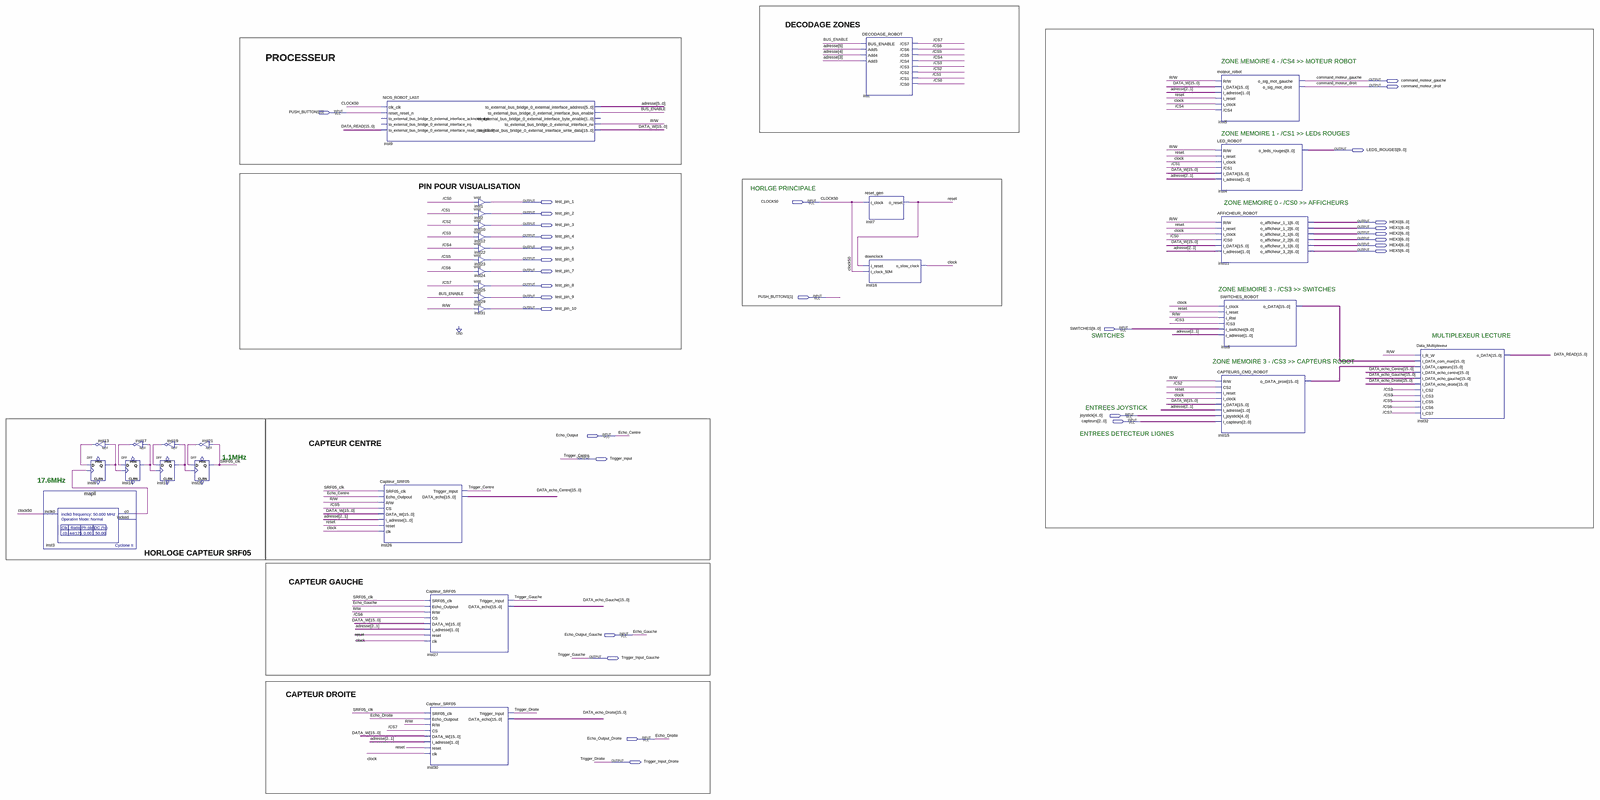
[diagram p0: schematic sheet, whole]
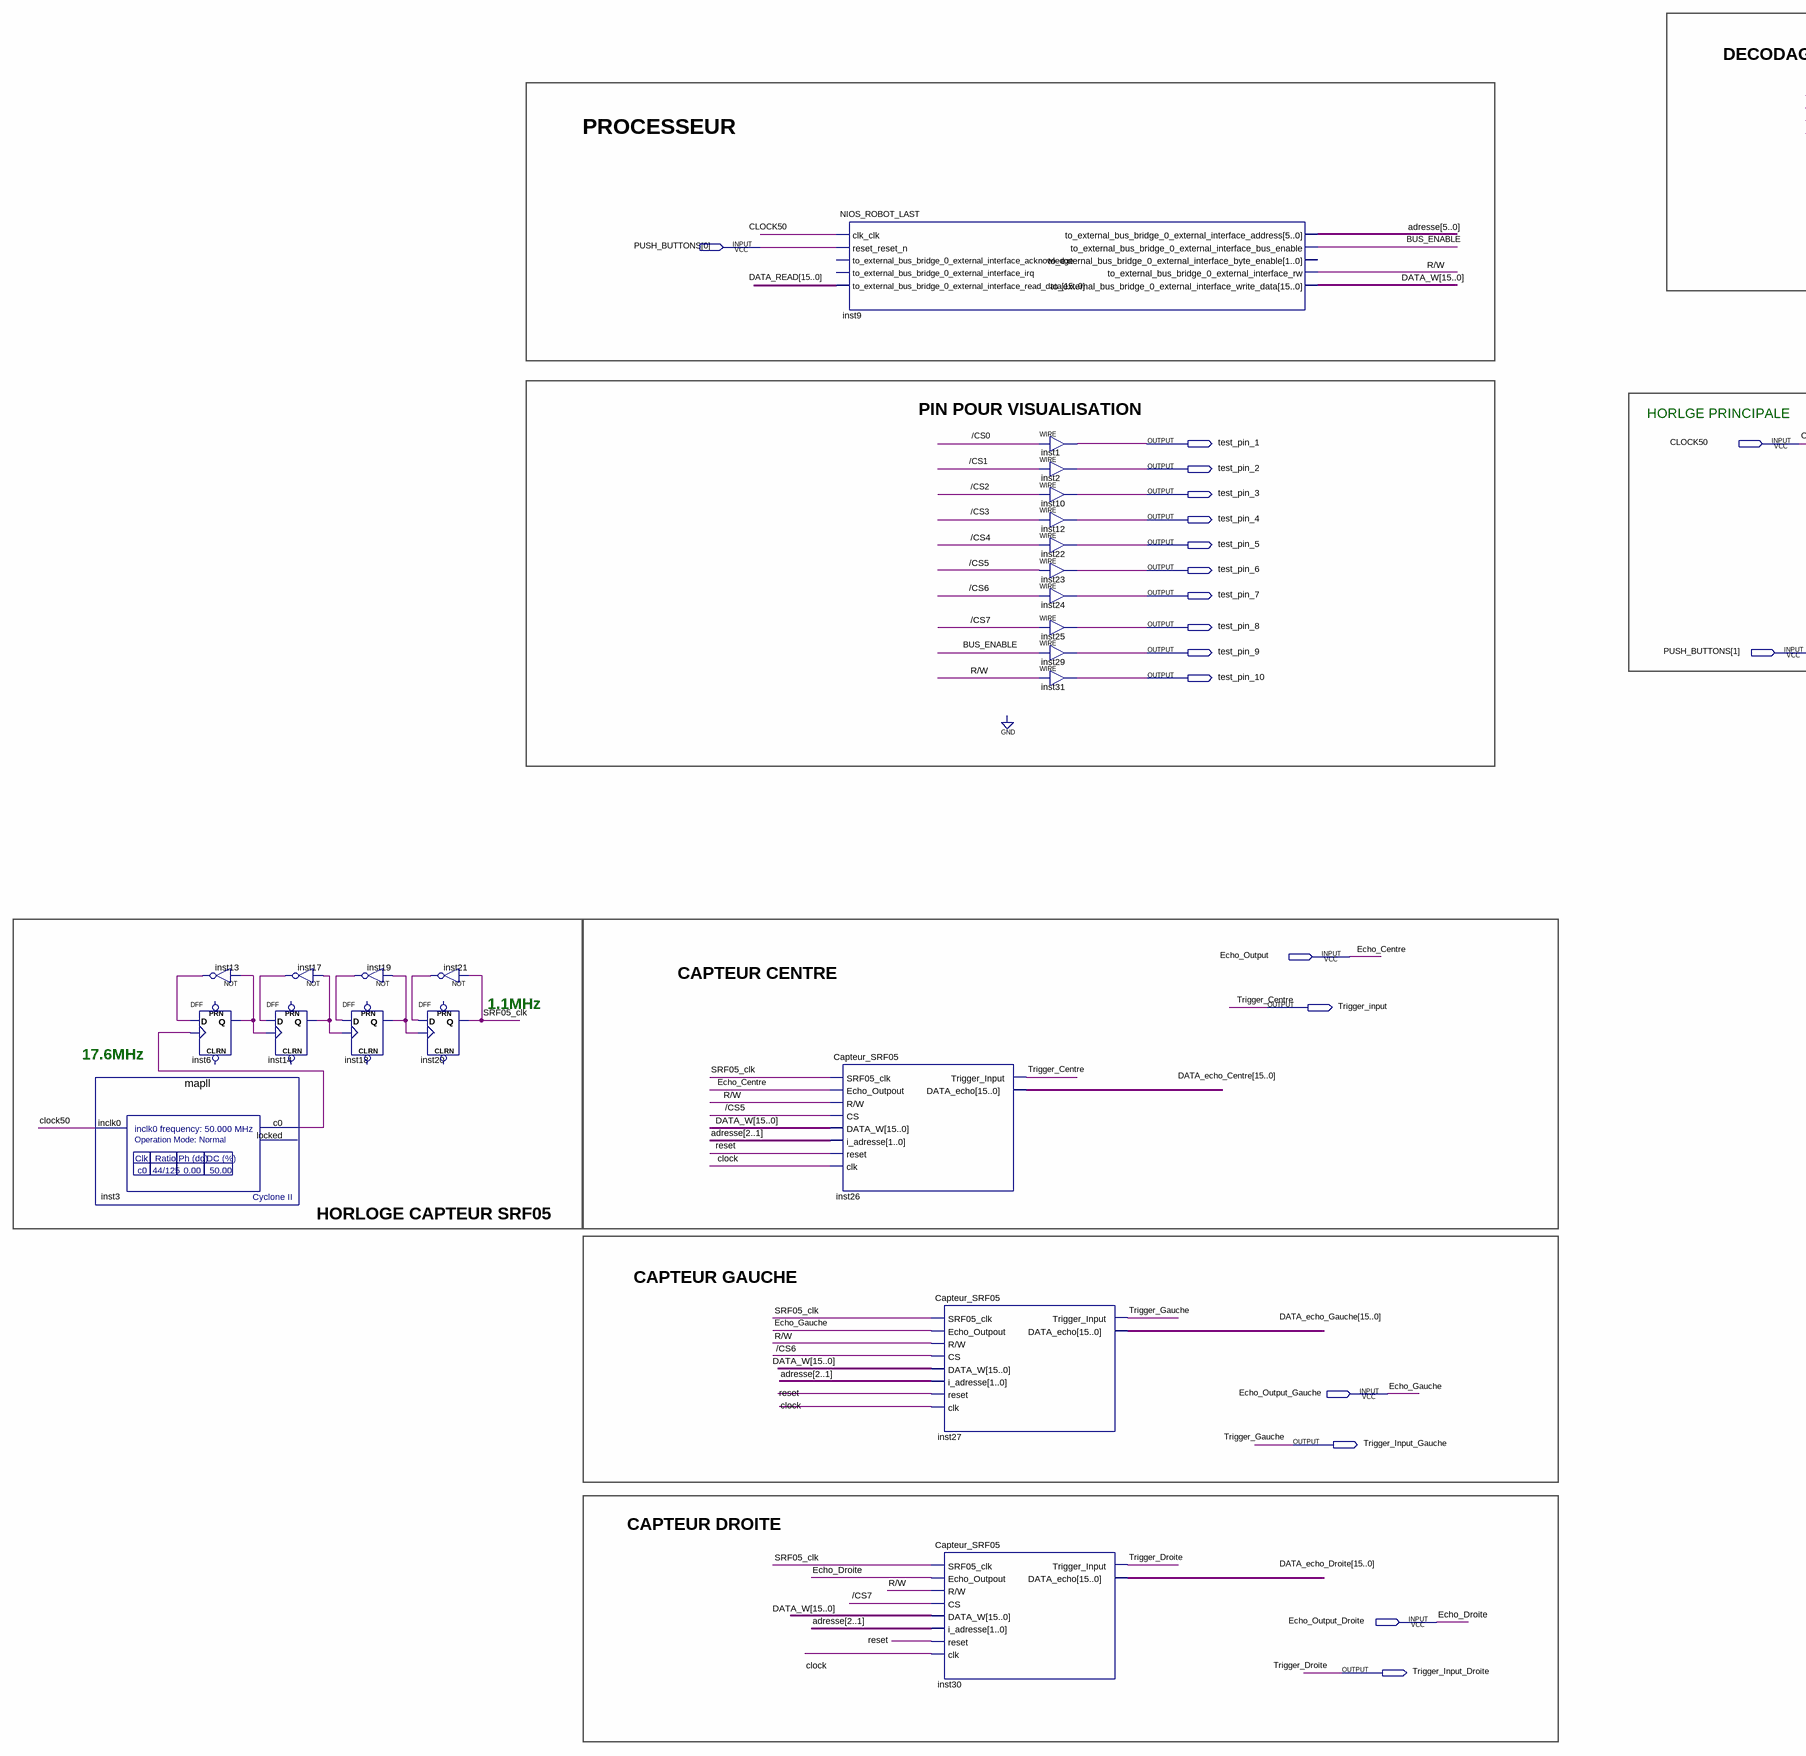
[diagram p1: schematic sheet, left part]
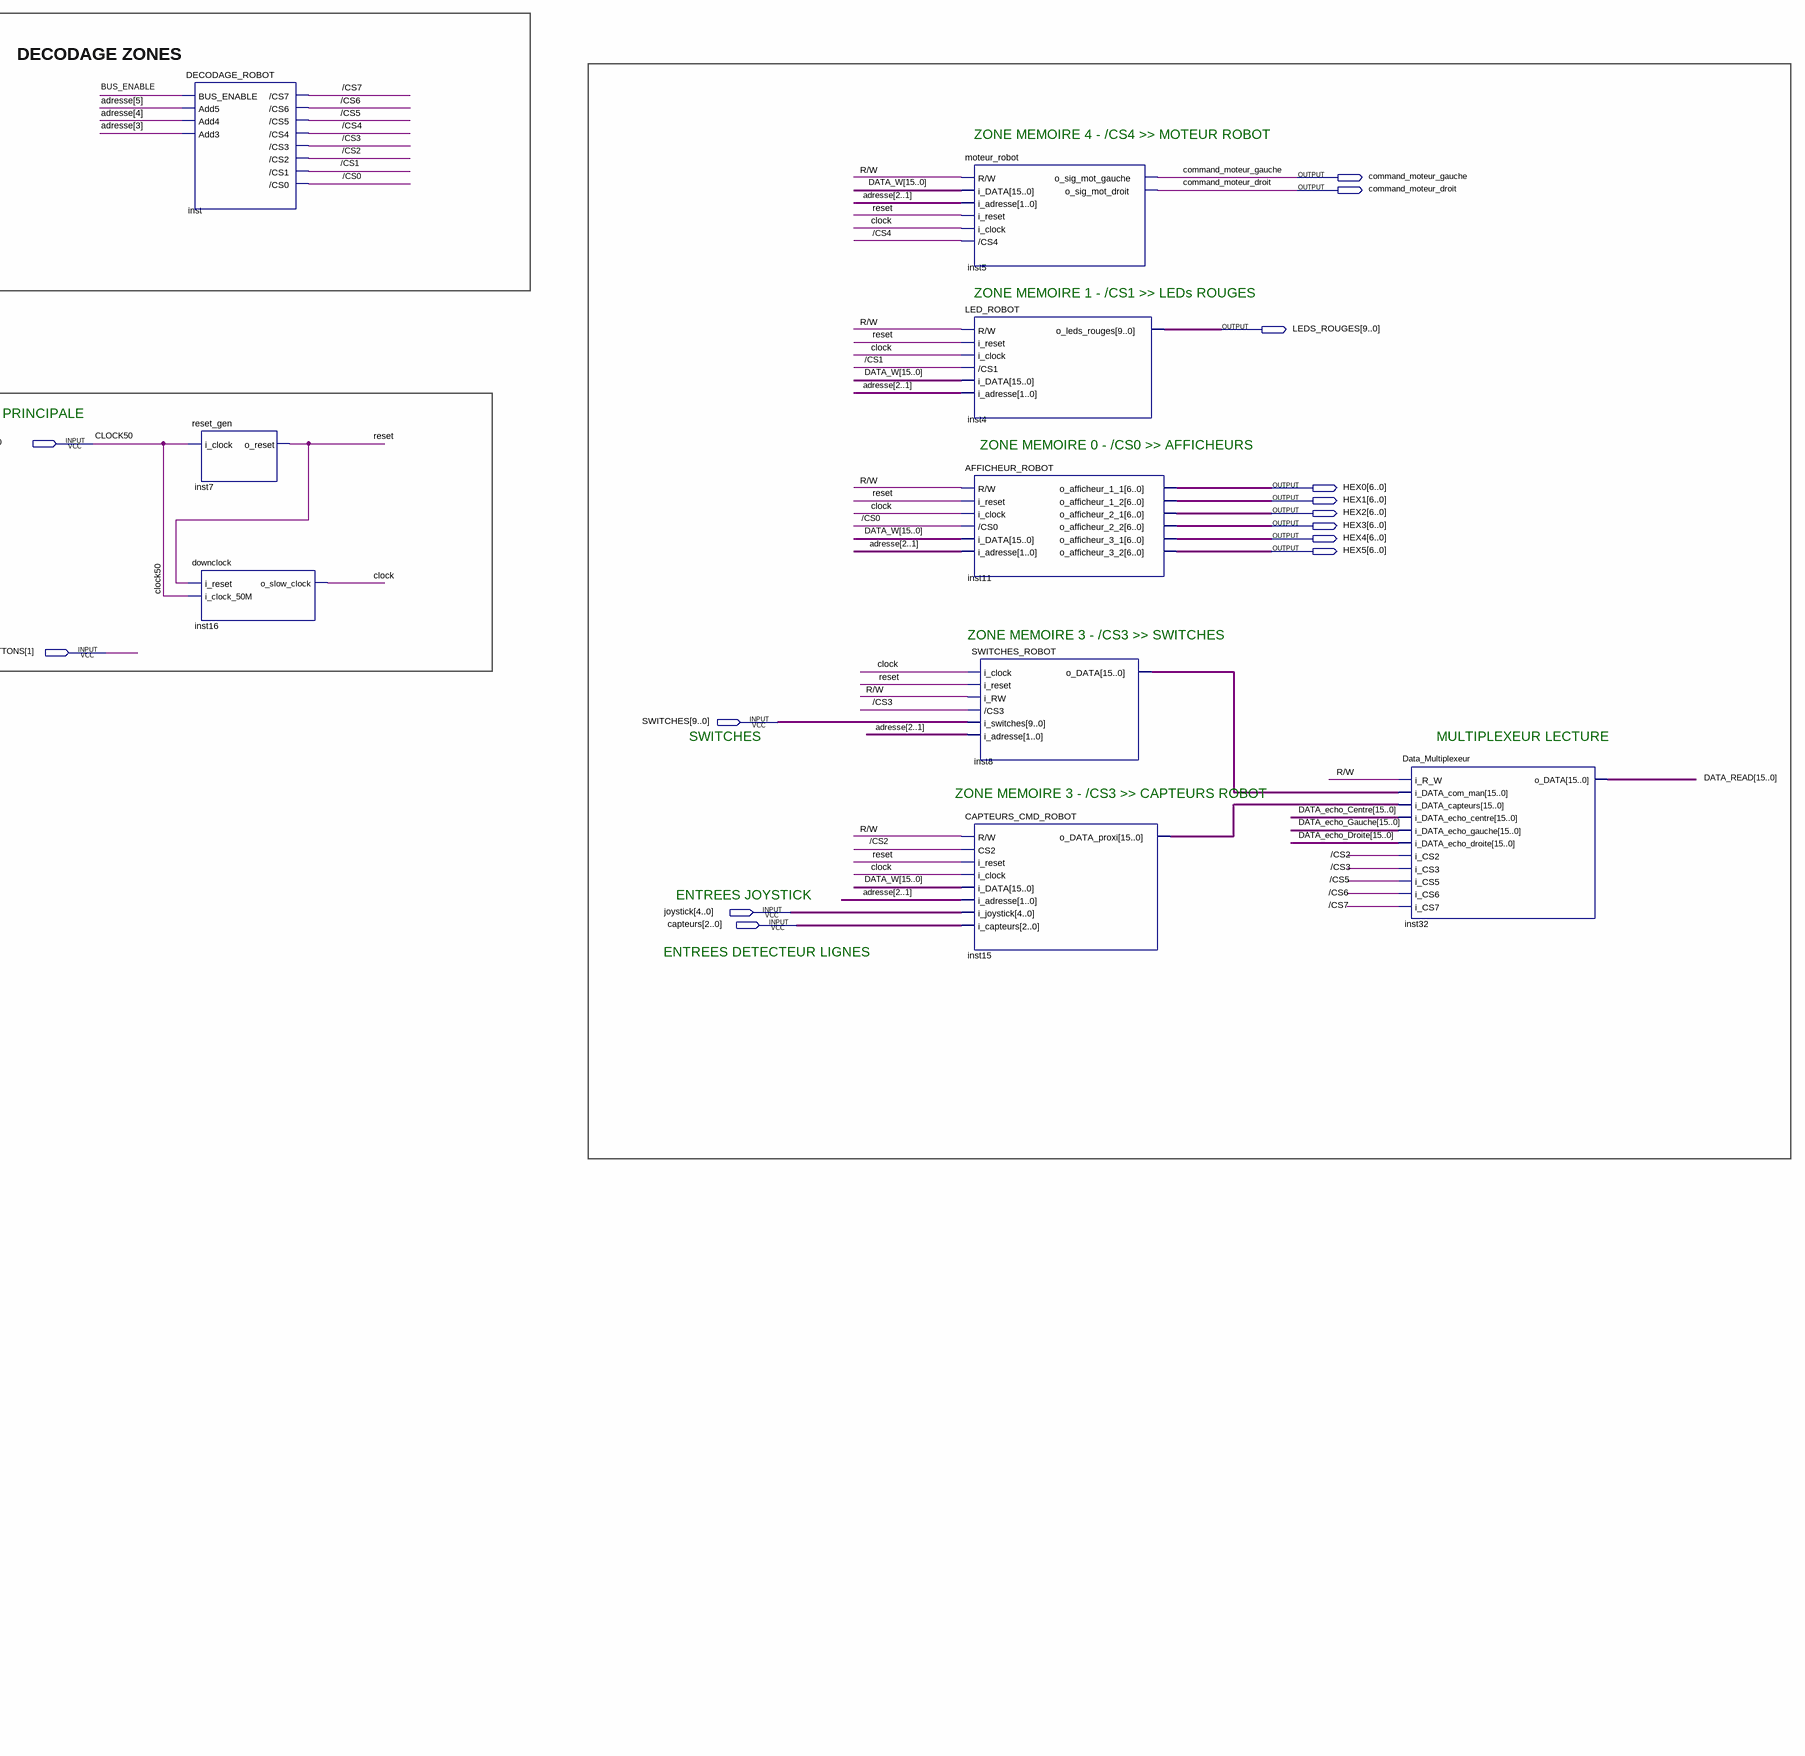
[diagram p2: schematic sheet, right part]
// Quartus schematic peripheriques.bdf as structural Verilog: 32 symbols, 31 pins
module peripheriques (
  input  [1:0] PUSH_BUTTONS,
  input  CLOCK50,
  input  [9:0] SWITCHES,
  input  [4:0] joystick,
  input  [2:0] capteurs,
  input  Echo_Output,
  input  Echo_Output_Gauche,
  input  Echo_Output_Droite,
  output command_moteur_gauche,
  output command_moteur_droit,
  output [9:0] LEDS_ROUGES,
  output test_pin_1,
  output test_pin_2,
  output [6:0] HEX0,
  output test_pin_3,
  output [6:0] HEX1,
  output [6:0] HEX2,
  output test_pin_4,
  output [6:0] HEX3,
  output [6:0] HEX4,
  output test_pin_5,
  output [6:0] HEX5,
  output test_pin_6,
  output test_pin_7,
  output test_pin_8,
  output test_pin_9,
  output test_pin_10,
  output Trigger_input,
  output Trigger_Input_Gauche,
  output Trigger_Input_Droite
);

  wire \/CS0 , \/CS1 , \/CS2 , \/CS3 , \/CS4 , \/CS5 , \/CS6 , \/CS7 , BUS_ENABLE, clock, inst3_c0, inst6_q,
       inst13_out, inst14_q, inst17_out, inst18_q, inst19_out, inst21_out, \R/W , reset, SRF05_clk;
  wire [5:0] adresse;
  wire [15:0] DATA_echo_Centre, DATA_echo_Droite, DATA_echo_Gauche, DATA_READ, DATA_W, inst8_o_data,
       inst15_o_data_proxi;

  mapll inst3 (.inclk0(CLOCK50), .c0(inst3_c0));  // open: locked
  DFF inst6 (.CLK(inst3_c0), .D(inst13_out), .Q(inst6_q));  // open: CLRN, PRN
  not inst13 (inst13_out, inst6_q);
  not inst17 (inst17_out, inst14_q);
  DFF inst14 (.CLK(inst6_q), .D(inst17_out), .Q(inst14_q));  // open: CLRN, PRN
  DFF inst18 (.CLK(inst14_q), .D(inst19_out), .Q(inst18_q));  // open: CLRN, PRN
  not inst19 (inst19_out, inst18_q);
  not inst21 (inst21_out, SRF05_clk);
  DFF inst20 (.CLK(inst18_q), .D(inst21_out), .Q(SRF05_clk));  // open: CLRN, PRN
  NIOS_ROBOT_LAST inst9 (
    .clk_clk(CLOCK50), .reset_reset_n(PUSH_BUTTONS[0]),
    .to_external_bus_bridge_0_external_interface_read_data(DATA_READ),
    .to_external_bus_bridge_0_external_interface_address(adresse),
    .to_external_bus_bridge_0_external_interface_bus_enable(BUS_ENABLE),
    .to_external_bus_bridge_0_external_interface_rw(\R/W ),
    .to_external_bus_bridge_0_external_interface_write_data(DATA_W));  // open: to_external_bus_bridge_0_external_interface_acknowledge, to_external_bus_bridge_0_external_interface_irq, to_external_bus_bridge_0_external_interface_byte_enable
  Capteur_SRF05 inst26 (
    .SRF05_clk(SRF05_clk), .Echo_Outpout(Echo_Output), .\R/W (\R/W ), .CS(\/CS5 ), .DATA_W(DATA_W),
    .i_adresse(adresse[2:1]), .reset(reset), .clk(clock), .Trigger_Input(Trigger_input),
    .DATA_echo(DATA_echo_Centre));
  Capteur_SRF05 inst27 (
    .SRF05_clk(SRF05_clk), .Echo_Outpout(Echo_Output_Gauche), .\R/W (\R/W ), .CS(\/CS6 ), .DATA_W(DATA_W),
    .i_adresse(adresse[2:1]), .reset(reset), .clk(clock), .Trigger_Input(Trigger_Input_Gauche),
    .DATA_echo(DATA_echo_Gauche));
  Capteur_SRF05 inst30 (
    .SRF05_clk(SRF05_clk), .Echo_Outpout(Echo_Output_Droite), .\R/W (\R/W ), .CS(\/CS7 ), .DATA_W(DATA_W),
    .i_adresse(adresse[2:1]), .reset(reset), .clk(clock), .Trigger_Input(Trigger_Input_Droite),
    .DATA_echo(DATA_echo_Droite));
  assign test_pin_1 = \/CS0 ;  // WIRE inst1
  assign test_pin_2 = \/CS1 ;  // WIRE inst2
  assign test_pin_3 = \/CS2 ;  // WIRE inst10
  assign test_pin_4 = \/CS3 ;  // WIRE inst12
  assign test_pin_5 = \/CS4 ;  // WIRE inst22
  assign test_pin_6 = \/CS5 ;  // WIRE inst23
  assign test_pin_7 = \/CS6 ;  // WIRE inst24
  assign test_pin_8 = \/CS7 ;  // WIRE inst25
  assign test_pin_9 = BUS_ENABLE;  // WIRE inst29
  assign test_pin_10 = \R/W ;  // WIRE inst31
  DECODAGE_ROBOT inst (
    .BUS_ENABLE(BUS_ENABLE), .Add5(adresse[5]), .Add4(adresse[4]), .Add3(adresse[3]), .\/CS7 (\/CS7 ),
    .\/CS6 (\/CS6 ), .\/CS5 (\/CS5 ), .\/CS4 (\/CS4 ), .\/CS3 (\/CS3 ), .\/CS2 (\/CS2 ), .\/CS1 (\/CS1 ),
    .\/CS0 (\/CS0 ));
  reset_gen inst7 (.i_clock(CLOCK50), .o_reset(reset));
  downclock inst16 (.i_reset(reset), .i_clock_50M(CLOCK50), .o_slow_clock(clock));
  moteur_robot inst5 (
    .\R/W (\R/W ), .i_DATA(DATA_W), .i_adresse(adresse[2:1]), .i_reset(reset), .i_clock(clock),
    .\/CS4 (\/CS4 ), .o_sig_mot_gauche(command_moteur_gauche), .o_sig_mot_droit(command_moteur_droit));
  LED_ROBOT inst4 (
    .\R/W (\R/W ), .i_reset(reset), .i_clock(clock), .\/CS1 (\/CS1 ), .i_DATA(DATA_W),
    .i_adresse(adresse[2:1]), .o_leds_rouges(LEDS_ROUGES));
  AFFICHEUR_ROBOT inst11 (
    .\R/W (\R/W ), .i_reset(reset), .i_clock(clock), .\/CS0 (\/CS0 ), .i_DATA(DATA_W),
    .i_adresse(adresse[2:1]), .o_afficheur_1_1(HEX0), .o_afficheur_1_2(HEX1), .o_afficheur_2_1(HEX2),
    .o_afficheur_2_2(HEX3), .o_afficheur_3_1(HEX4), .o_afficheur_3_2(HEX5));
  SWITCHES_ROBOT inst8 (
    .i_clock(clock), .i_reset(reset), .i_RW(\R/W ), .\/CS3 (\/CS3 ), .i_switches(SWITCHES),
    .i_adresse(adresse[2:1]), .o_DATA(inst8_o_data));
  CAPTEURS_CMD_ROBOT inst15 (
    .\R/W (\R/W ), .CS2(\/CS2 ), .i_reset(reset), .i_clock(clock), .i_DATA(DATA_W), .i_adresse(adresse[2:1]),
    .i_joystick(joystick), .i_capteurs(capteurs), .o_DATA_proxi(inst15_o_data_proxi));
  Data_Multiplexeur inst32 (
    .i_R_W(\R/W ), .i_DATA_com_man(inst8_o_data), .i_DATA_capteurs(inst15_o_data_proxi),
    .i_DATA_echo_centre(DATA_echo_Centre), .i_DATA_echo_gauche(DATA_echo_Gauche),
    .i_DATA_echo_droite(DATA_echo_Droite), .i_CS2(\/CS2 ), .i_CS3(\/CS3 ), .i_CS5(\/CS5 ), .i_CS6(\/CS6 ),
    .i_CS7(\/CS7 ), .o_DATA(DATA_READ));

  // Other names for the same wires on the sheet: Echo_Centre = Echo_Output; Echo_Droite = Echo_Output_Droite;
  //   Echo_Gauche = Echo_Output_Gauche; Trigger_Centre = Trigger_input; Trigger_Droite = Trigger_Input_Droite;
  //   Trigger_Gauche = Trigger_Input_Gauche

  // Notes on the sheet:
  //   DECODAGE ZONES
  //   PROCESSEUR
  //   ZONE MEMOIRE 4 - /CS4 >> MOTEUR ROBOT
  //   ZONE MEMOIRE 1 - /CS1 >> LEDs ROUGES
  //   PIN POUR VISUALISATION
  //   HORLGE PRINCIPALE
  //   ZONE MEMOIRE 0 - /CS0 >> AFFICHEURS
  //   ZONE MEMOIRE 3 - /CS3 >> SWITCHES
  //   SWITCHES
  //   MULTIPLEXEUR LECTURE
  //   ZONE MEMOIRE 3 - /CS3 >> CAPTEURS ROBOT
  //   ENTREES JOYSTICK
  //   ENTREES DETECTEUR LIGNES
  //   CAPTEUR CENTRE
  //   1.1MHz
  //   17.6MHz
  //   HORLOGE CAPTEUR SRF05
  //   CAPTEUR GAUCHE
  //   CAPTEUR DROITE
endmodule
